# Altium schematic sheet Bank224.SchDoc: Bank224
size A3; Organization: Altium Limited; Address1: L3, 12a Rodborough Rd; Address2: Frenchs Forest; Address3: NSW; Address4: Australia 2086
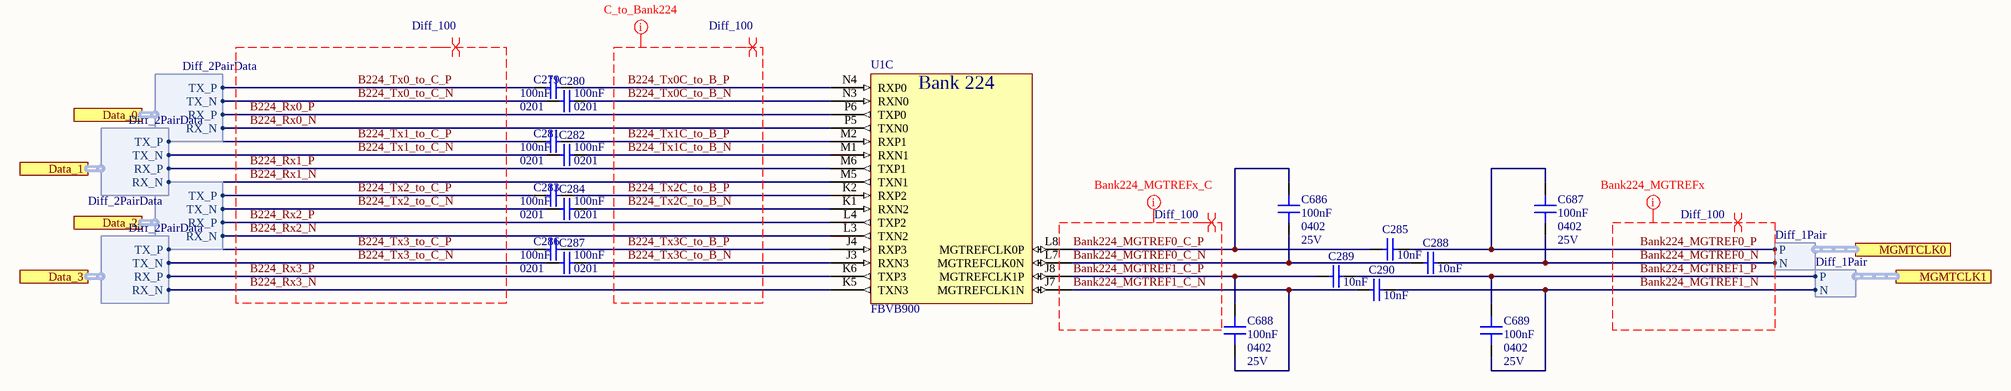
[diagram p0: Bank224.SchDoc]

## Parts
C279  100nF  Case/Package: 0201  [CAP 0201/0603 KK]
C280  100nF  Case/Package: 0201  [CAP 0201/0603 KK]
C281  100nF  Case/Package: 0201  [CAP 0201/0603 KK]
C282  100nF  Case/Package: 0201  [CAP 0201/0603 KK]
C283  100nF  Case/Package: 0201  [CAP 0201/0603 KK]
C284  100nF  Case/Package: 0201  [CAP 0201/0603 KK]
C285  10nF  [CAP 0201/0603 KK]
C286  100nF  Case/Package: 0201  [CAP 0201/0603 KK]
C287  100nF  Case/Package: 0201  [CAP 0201/0603 KK]
C288  10nF  [CAP 0201/0603 KK]
C289  10nF  [CAP 0201/0603 KK]
C290  10nF  [CAP 0201/0603 KK]
C686  100nF  Case/Package: 0402  Voltage Rating: 25V  [CAP 0402/1005 KK]
C687  100nF  Case/Package: 0402  Voltage Rating: 25V  [CAP 0402/1005 KK]
C688  100nF  Case/Package: 0402  Voltage Rating: 25V  [CAP 0402/1005 KK]
C689  100nF  Case/Package: 0402  Voltage Rating: 25V  [CAP 0402/1005 KK]
U1  FBVB900  [FBVB900 XX]  (part C of 23)

## Ports
Data_0 (harness Diff_2PairData), Data_1 (harness Diff_2PairData), Data_2 (harness Diff_2PairData), Data_3 (harness Diff_2PairData), MGMTCLK0 (harness Diff_1Pair), MGMTCLK1 (harness Diff_1Pair)

## Harnesses
Diff_1Pair: P, N
Diff_2PairData: RX_P, RX_N, TX_P, TX_N

## Nets
B224_Rx0_N: U1.P5(TXN0) ; port Data_0.RX_N
B224_Rx0_P: U1.P6(TXP0) ; port Data_0.RX_P
B224_Rx1_N: U1.M5(TXN1) ; port Data_1.RX_N
B224_Rx1_P: U1.M6(TXP1) ; port Data_1.RX_P
B224_Rx2_N: U1.L3(TXN2) ; port Data_2.RX_N
B224_Rx2_P: U1.L4(TXP2) ; port Data_2.RX_P
B224_Rx3_N: U1.K5(TXN3) ; port Data_3.RX_N
B224_Rx3_P: U1.K6(TXP3) ; port Data_3.RX_P
B224_Tx0_to_C_N: C280.1 ; port Data_0.TX_N
B224_Tx0_to_C_P: C279.1 ; port Data_0.TX_P
B224_Tx0C_to_B_N: C280.2 U1.N3(RXN0)
B224_Tx0C_to_B_P: C279.2 U1.N4(RXP0)
B224_Tx1_to_C_N: C282.1 ; port Data_1.TX_N
B224_Tx1_to_C_P: C281.1 ; port Data_1.TX_P
B224_Tx1C_to_B_N: C282.2 U1.M1(RXN1)
B224_Tx1C_to_B_P: C281.2 U1.M2(RXP1)
B224_Tx2_to_C_N: C284.1 ; port Data_2.TX_N
B224_Tx2_to_C_P: C283.1 ; port Data_2.TX_P
B224_Tx2C_to_B_N: C284.2 U1.K1(RXN2)
B224_Tx2C_to_B_P: C283.2 U1.K2(RXP2)
B224_Tx3_to_C_N: C287.1 ; port Data_3.TX_N
B224_Tx3_to_C_P: C286.1 ; port Data_3.TX_P
B224_Tx3C_to_B_N: C287.2 U1.J3(RXN3)
B224_Tx3C_to_B_P: C286.2 U1.J4(RXP3)
Bank224_MGTREF0_C_N: C288.1 C686.2 U1.L7(MGTREFCLK0N)
Bank224_MGTREF0_C_P: C285.1 C686.1 U1.L8(MGTREFCLK0P)
Bank224_MGTREF0_N: C288.2 C687.2 ; port MGMTCLK0.N
Bank224_MGTREF0_P: C285.2 C687.1 ; port MGMTCLK0.P
Bank224_MGTREF1_C_N: C290.1 C688.2 U1.J7(MGTREFCLK1N)
Bank224_MGTREF1_C_P: C289.1 C688.1 U1.J8(MGTREFCLK1P)
Bank224_MGTREF1_N: C290.2 C689.2 ; port MGMTCLK1.N
Bank224_MGTREF1_P: C289.2 C689.1 ; port MGMTCLK1.P

## Layout directives
net class C_to_Bank224: B224_Tx0C_to_B_N, B224_Tx0C_to_B_P, B224_Tx1C_to_B_N, B224_Tx1C_to_B_P, B224_Tx2C_to_B_N, B224_Tx2C_to_B_P, B224_Tx3C_to_B_N, B224_Tx3C_to_B_P
net class Bank224_MGTREFx_C: Bank224_MGTREF0_C_N, Bank224_MGTREF0_C_P, Bank224_MGTREF1_C_N, Bank224_MGTREF1_C_P
differential pair; differential pair class Diff_100: B224_Rx0_N, B224_Rx0_P, B224_Rx1_N, B224_Rx1_P, B224_Rx2_N, B224_Rx2_P, B224_Rx3_N, B224_Rx3_P, B224_Tx0_to_C_N, B224_Tx0_to_C_P, B224_Tx0C_to_B_N, B224_Tx0C_to_B_P, B224_Tx1_to_C_N, B224_Tx1_to_C_P, B224_Tx1C_to_B_N, B224_Tx1C_to_B_P, B224_Tx2_to_C_N, B224_Tx2_to_C_P, B224_Tx2C_to_B_N, B224_Tx2C_to_B_P, B224_Tx3_to_C_N, B224_Tx3_to_C_P, B224_Tx3C_to_B_N, B224_Tx3C_to_B_P, Bank224_MGTREF0_C_N, Bank224_MGTREF0_C_P, Bank224_MGTREF0_N, Bank224_MGTREF0_P, Bank224_MGTREF1_C_N, Bank224_MGTREF1_C_P, Bank224_MGTREF1_N, Bank224_MGTREF1_P
net class Bank224_MGTREFx: Bank224_MGTREF0_N, Bank224_MGTREF0_P, Bank224_MGTREF1_N, Bank224_MGTREF1_P

## Notes on the sheet
- Title
- Size:
- Date:
- A3
- Number:
- Time:
- Revision:
- Sheet
- of
- File:
- (in symbol FBVB900, part C) Bank 224

## Library data of the parts
C279-C284 C286 C287 = Capacitor: CAP CER 0.1UF 16V X5R 0201; Manufacturer: Murata; Manufacturer Part Number: GRM033R61C104ME84D; Tolerance: 20%; Supplier 1: Digi-Key; Supplier Part Number 1: 490-9986-1-ND; RoHS: Yes; Category: Ceramic Capacitors; Stock 1: 519119; Pricing 1: 1=0,10000, 10=0,06000, 100=0,02670, 500=0,01906, 1000=0,01497, 2500=0,01361, 5000=0,01252 (USD); Mount: Surface Mount; Weight: 1.2E-05oz; Case Code (Metric): 0603; Min Operating Temperature: -55°C; Max Operating Temperature: 85°C; Capacitance: 100nF; Packaging: Tape and Reel; Voltage Rating: 16V; Dielectric: X5R; Termination: SMD/SMT; Voltage Rating (DC): 16V; Package Quantity: 15000; Length: 0.024inch; Height: 0.3mm; Width: 0.3mm; Thickness: 0.013inch; ComponentLink1URL: http://www.mouser.com/ds/2/281/c02e-2905.pdf?src-supplier=Mouser; ComponentLink1Description: http://www.mouser.com/ds/2/281/c02e-2905.pdf?src-supplier=Mouser; ComponentLink2URL: http://search.murata.co.jp/Ceramy/image/img/A01X/G101/ENG/GRM033R61C104ME84-01.pdf?src-supplier=Digi-Key; ComponentLink2Description: http://search.murata.co.jp/Ceramy/image/img/A01X/G101/ENG/GRM033R61C104ME84-01.pdf?src-supplier=Digi-Key
  C280 C282 C284 C287: Case Code (Imperial): 0201
C285 C288-C290 = Capacitor: CAP CER 10000PF 16V X7R 0201; Manufacturer: Murata; Manufacturer Part Number: GRM033R71C103KE14D; Tolerance: 10%; Supplier 1: Digi-Key; Supplier Part Number 1: 490-14453-1-ND; RoHS: No; Category: Ceramic Capacitors; Stock 1: 188777; Pricing 1: 1=0,10000, 10=0,01900, 100=0,00870, 500=0,00620, 1000=0,00487, 2500=0,00443, 5000=0,00407 (USD); Voltage Rating (DC): 16V; Dielectric: X7R; Capacitance: 10nF; Length: 600um; Width: 300um; Thickness: 300um; ComponentLink1URL: http://www.farnell.com/datasheets/2722745.pdf?src-supplier=Farnell; ComponentLink1Description: http://www.farnell.com/datasheets/2722745.pdf?src-supplier=Farnell; ComponentLink2URL: http://www.farnell.com/datasheets/2722745.pdf?src-supplier=Newark; ComponentLink2Description: http://www.farnell.com/datasheets/2722745.pdf?src-supplier=Newark; ComponentLink3URL: http://www.farnell.com/datasheets/2722745.pdf?src-supplier=Element14; ComponentLink3Description: http://www.farnell.com/datasheets/2722745.pdf?src-supplier=Element14; ComponentLink4URL: http://search.murata.co.jp/Ceramy/image/img/A01X/G101/ENG/GRM033R71C103KE14-01.pdf?src-supplier=Digi-Key; ComponentLink4Description: http://search.murata.co.jp/Ceramy/image/img/A01X/G101/ENG/GRM033R71C103KE14-01.pdf?src-supplier=Digi-Key
C686-C689 = Capacitor: Manufacturer: Murata; Manufacturer Part Number: GRM155R71E104KE14J; Tolerance: 10%; Dielectric: X7R; Supplier 1: Digi-Key; Supplier Part Number 1: 490-14603-1-ND; Stock 1: 89275; Pricing 1: 1 = 0,10000, 10 = 0,03400, 100 = 0,01520, 500 = 0,01088, 1000 = 0,00855, 2500 = 0,00778, 5000 = 0,00715 (USD); RoHS: Yes; Mount: Surface Mount; Weight: 0.000212oz; Case Code (Imperial): 0402; Case Code (Metric): 1005; Min Operating Temperature: -55°C; Max Operating Temperature: 125°C; Packaging: Tape and Reel; Capacitance: 100nF; Termination: SMD/SMT; Composition: Ceramic; Voltage Rating (DC): 25V; Package Quantity: 50000; Length: 0.039inch; Height: 0.5mm; Width: 0.5mm; Thickness: 0.022inch; ComponentLink1URL: http://www.mouser.com/ds/2/281/c02e-2905.pdf?src-supplier=Mouser; ComponentLink1Description: http://www.mouser.com/ds/2/281/c02e-2905.pdf?src-supplier=Mouser; ComponentLink2URL: http://search.murata.co.jp/Ceramy/image/img/A01X/G101/ENG/GRM155R71E104KE14-01.pdf?src-supplier=Digi-Key; ComponentLink2Description: http://search.murata.co.jp/Ceramy/image/img/A01X/G101/ENG/GRM155R71E104KE14-01.pdf?src-supplier=Digi-Key
U1 = FBVB900: FPGA Zynq UltraScale+ Family 192150 Cells 20nm Technology 0.85V 900-Pin FCBGA Tray; Manufacturer Part Number: XCZU4CG-1FBVB900E; Manufacturer: Xilinx; Peripherals: WDT,DMA; Interface: I2C,SPI,USB,Ethernet,MMC,SDIO,SD,UART,USART,EBI/EMI; Core Architecture: ARM; RAM Size: 256KB; Frequency: 500MHz; Number of I/Os: 204; Supplier 1: Mouser; Supplier Part Number 1: 217-CZU4CG-1FBVB900E; Stock 1: 3; Pricing 1: 1=0,00000, 5=1060,70000 (USD); RoHS: No; Case/Package: FCBGA; Min Operating Temperature: 0°C; Max Operating Temperature: 100°C; Packaging: Tray; ComponentLink1URL: https://www.xilinx.com/support/documentation/data_sheets/ds891-zynq-ultrascale-plus-overview.pdf?src-supplier=Digi-Key; ComponentLink1Description: https://www.xilinx.com/support/documentation/data_sheets/ds891-zynq-ultrascale-plus-overview.pdf?src-supplier=Digi-Key; ComponentLink2URL: https://www.xilinx.com/support/documentation/data_sheets/ds925-zynq-ultrascale-plus.pdf?src-supplier=Digi-Key; ComponentLink2Description: https://www.xilinx.com/support/documentation/data_sheets/ds925-zynq-ultrascale-plus.pdf?src-supplier=Digi-Key; Supplier 2: Avnet; Supplier 3: Digi-Key; Supplier Part Number 2: XCZU4CG-1FBVB900E; Supplier Part Number 3: XCZU4CG-1FBVB900E-ND